# Altium schematic sheet 02.C108. A41-A72. Module AC220V.SchDoc: Кабель блока инвертора 220В
size 209 x 297 mm; Author: Мурашкин Д.В.; Address1: Address1; Address2: Address2; Address3: Address3; Address4: Address4; DocumentNumber: ИЗДЕЛИЕ-1-2; SheetNumber: 10; Scale: 1:1; Letter1Column: Э
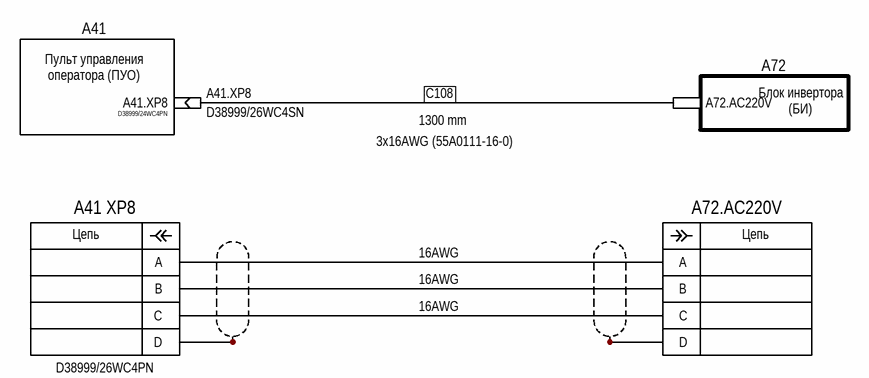
[diagram p0: 02.C108. A41-A72. Module AC220V.SchDoc]

## Parts
(Parts that share a designator on the sheet are numbered #1, #2 ... from top to bottom, then left to right.)
A41.XP8#1  D38999/24WC4PN
A41.XP8#2  D38999/26WC4SN
A41_XP8  D38999/26WC4PN
A72.AC220V#1  Провод  (value not drawn)  (no BOM)
A72.AC220V#2  (no value)

## Nets
С108: A41.XP8#2.0 A72.AC220V#1.0
NetA41_XP8_A: A41_XP8.A A72.AC220V#2.A
NetA41_XP8_B: A41_XP8.B A72.AC220V#2.B
NetA41_XP8_C: A41_XP8.C A72.AC220V#2.C

Not connected (* = marked no-connect by the designer): A41.XP8#1 0; A41_XP8 D; A72.AC220V#2 D

## Notes on the sheet
- A41
- (near A41.XP8#1) Пульт управления оператора (ПУО)
- A72
- 3x16AWG (55A0111-16-0)
- 1300 mm
- (near A72.AC220V#1) Блок инвертора (БИ)
- 16AWG
- Перв. примен.
- Справ. №
- Подп. и дата
- Инв. № дубл.
- Взам. инв. №
- Инв. № подл.
- Изм.
- Лист
- № докум.
- Подп.
- Дата
- 2.106-A4
- Копировал
- Формат А4
- (in symbol Connector signal P5_1) Цепь

## Library data of the parts
A41.XP8#1 = Connector cable socket: Operating temperature: -°C +°C; Mounting type: Surface mount; Dimension: .0mm x .0mm; Height: .0mm
A41.XP8#2 = Connector cable plug: Part name: D38999/26WD97PN; Operating temperature: -°C +°C; Mounting type: Surface mount; Dimension: .0mm x .0mm; Height: .0mm
A41_XP8 A72.AC220V#2 = Connector signal P5_1: P4 MIL; Operating temperature: -°C +°C; Mounting type: Surface mount; Dimension: .0mm x .0mm; Height: .0mm
A72.AC220V#1 = Connector cable coupling: Operating temperature: -°C +°C; Mounting type: Surface mount; Dimension: .0mm x .0mm; Height: .0mm